# Altium schematic sheet Sheet_1.schdoc
size 292 x 205 mm; Device: A_A4; Symbol: A_A4; Name: A_A4; Designator: A; @Project Name: Orion S6; REV: 1.0; Date: 2026-10-26; Sheet: 1/1; Draw By: Mustafa Berisha; Company: Orion; Manufacturer Part: ?; Convert to PCB: yes; Add into BOM: yes; Origin Footprint: NONE; Unique ID: frame_lib_1
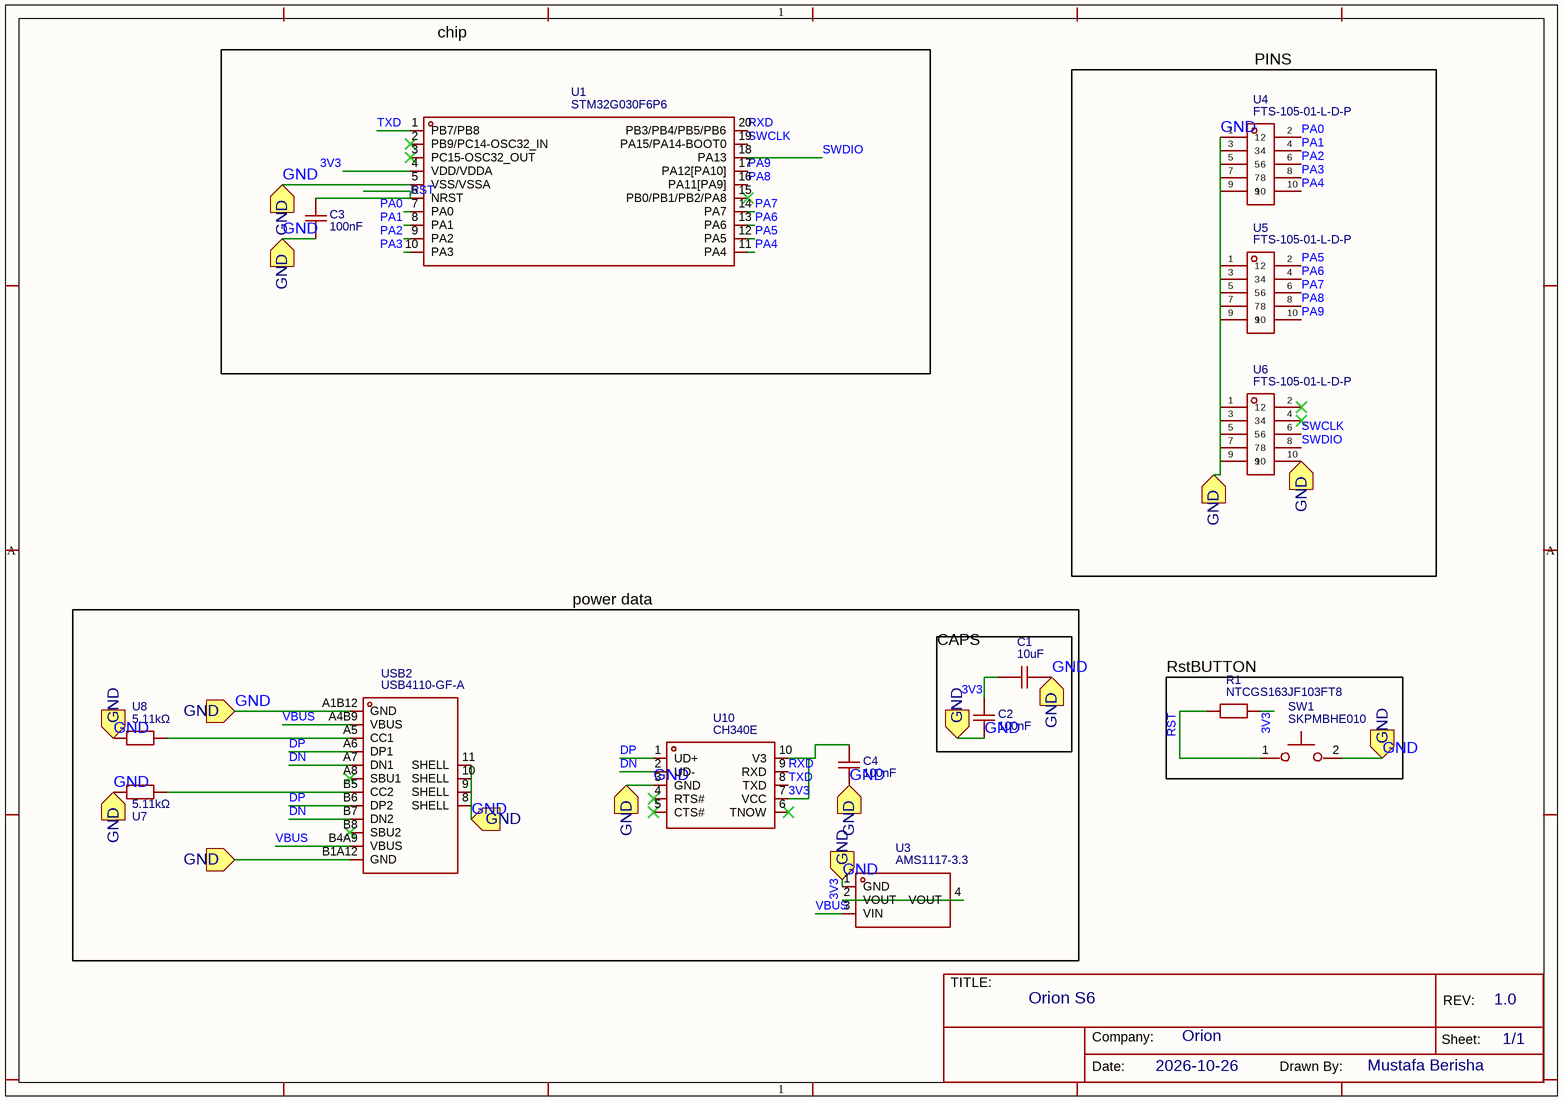
[diagram p0: Sheet_1.schdoc]

## Parts
C1  10uF  [C1206]
C2  100nF  [C0402]
C3  100nF  [C0402]
C4  100nF  [C0402]
R1  NTCGS163JF103FT8  [R0603]
SW1  SKPMBHE010  [KEY-SMD_2P-L6.0-W6.0-P6.00]
U1  STM32G030F6P6  [TSSOP-20_L6.5-W4.4-P0.65-LS6.4-BL]
U3  AMS1117-3.3  [SOT-223-3_L6.5-W3.4-P2.30-LS7.0-BR]
U4  FTS-105-01-L-D-P
U5  FTS-105-01-L-D-P
U6  FTS-105-01-L-D-P
U7  5.11kΩ  [RES-TH_BD2.4-L6.3-P10.30-D0.6]
U8  5.11kΩ  [RES-TH_BD2.4-L6.3-P10.30-D0.6]
U10  CH340E  [MSOP-10_L3.0-W3.0-P0.50-LS5.0-BL]
USB2  USB4110-GF-A  [USB-C-SMD_TYPE-C-16P-USB4110-GF-A]

## Blocks framed on the sheet
chip: C3 U1
PINS: U4-U6
power data: C4 U3 U7 U8 U10 USB2
CAPS: C1 C2
RstBUTTON: R1 SW1

## Ports
GND (in)

## Nets
3V3: C1.1 C2.1 C4.2 R1.2 U1.4(VDD/VDDA) U3.2(VOUT) U3.4(VOUT) U10.7(VCC) U10.10(V3)
DN: U10.2(UD-) USB2.A7(DN1) USB2.B7(DN2)
DP: U10.1(UD+) USB2.A6(DP1) USB2.B6(DP2)
GND: C1.2 C2.2 C3.1 C4.1 SW1.2 U1.5(VSS/VSSA) U3.1(GND) U4.1 U4.3 U4.5 U4.7 U4.9 U5.1 U5.3 U5.5 U5.7 U5.9 U6.1 U6.3 U6.5 U6.7 U6.9 U6.10 U7.2 U8.2 U10.3(GND) USB2.8(SHELL) USB2.9(SHELL) USB2.10(SHELL) USB2.11(SHELL) USB2.A1B12(GND) USB2.B1A12(GND) ; port GND
PA0: U1.7(PA0) U4.2
PA1: U1.8(PA1) U4.4
PA2: U1.9(PA2) U4.6
PA3: U1.10(PA3) U4.8
PA4: U1.11(PA4) U4.10
PA5: U1.12(PA5) U5.2
PA6: U1.13(PA6) U5.4
PA7: U1.14(PA7) U5.6
PA8: U1.16(PA11[PA9]) U5.8
PA9: U1.17(PA12[PA10]) U5.10
RST: C3.2 R1.1 SW1.1 U1.6(NRST)
RXD: U1.20(PB3/PB4/PB5/PB6) U10.9(RXD)
SWCLK: U1.19(PA15/PA14-BOOT0) U6.6
SWDIO: U1.18(PA13) U6.8
TXD: U1.1(PB7/PB8) U10.8(TXD)
VBUS: U3.3(VIN) USB2.A4B9(VBUS) USB2.B4A9(VBUS)
NetU7_1: U7.1 USB2.B5(CC2)
NetU8_1: U8.1 USB2.A5(CC1)

Not connected (* = marked no-connect by the designer): U1 2(PB9/PC14-OSC32_IN)* 3(PC15-OSC32_OUT)* 15(PB0/PB1/PB2/PA8)*; U6 2* 4*; U10 4(RTS#)* 5(CTS#)* 6(TNOW)*; USB2 A8(SBU1)* B8(SBU2)*

## Notes on the sheet
- TITLE:
- Orion S6
- Company:
- Orion
- Sheet:
- REV:
- 1.0
- 1/1
- Date:
- 2026-10-26
- Drawn By:
- Mustafa Berisha

## Library data of the parts
C1 = GRM31CR71E106MA12L: Manufacturer: muRata(村田); Convert to PCB: yes; UniqueId: ggec3e58f7991b46dfc; Device: GRM31CR71E106MA12L; Symbol: 10uF; Supplier: LCSC; Supplier Part: C440205; Manufacturer Part: GRM31CR71E106MA12L; JLCPCB Part Class: Extended Part; Add into BOM: yes; Origin Footprint: C1206; FootprintName: C1206
C2 = GCM155R71H104KE02D: Manufacturer: muRata(村田); Convert to PCB: yes; UniqueId: gge3603b7792e9a1127; ModelId: 89fda7647e4f421c9745a20fb37cf3430819f05c4eef4c71ace90d822a990e87; Device: GCM155R71H104KE02D; Symbol: 100nF; Supplier: LCSC; Manufacturer Part: GCM155R71H104KE02D; Supplier Part: C85858; JLCPCB Part Class: Extended Part; Add into BOM: yes; Origin Footprint: C0402; FootprintName: C0402; ModelName: C0402
C3 = GCM155R71H104KE02D: Manufacturer: muRata(村田); Convert to PCB: yes; UniqueId: gge7001e8d40063aff4; ModelId: 89fda7647e4f421c9745a20fb37cf3430819f05c4eef4c71ace90d822a990e87; Device: GCM155R71H104KE02D; Symbol: 100nF; Supplier: LCSC; Manufacturer Part: GCM155R71H104KE02D; Supplier Part: C85858; JLCPCB Part Class: Extended Part; Add into BOM: yes; Origin Footprint: C0402; FootprintName: C0402; ModelName: C0402
C4 = GCM155R71H104KE02D: Manufacturer: muRata(村田); Convert to PCB: yes; UniqueId: ggefa68e47fd06b38dc; ModelId: 89fda7647e4f421c9745a20fb37cf3430819f05c4eef4c71ace90d822a990e87; Device: GCM155R71H104KE02D; Symbol: 100nF; Supplier: LCSC; Manufacturer Part: GCM155R71H104KE02D; Supplier Part: C85858; JLCPCB Part Class: Extended Part; Add into BOM: yes; Origin Footprint: C0402; FootprintName: C0402; ModelName: C0402
R1 = NTCGS163JF103FT8: Manufacturer: TDK; Convert to PCB: yes; UniqueId: gge509d891d0711bf9c; ModelId: 112863783b5b41f1b5254f87eedc79320819f05c4eef4c71ace90d822a990e87; Device: NTCGS163JF103FT8; Symbol: NTCGS163JF103FT8; Supplier: LCSC; Supplier Part: C22432708; Manufacturer Part: NTCGS163JF103FT8; JLCPCB Part Class: Extended Part; Add into BOM: yes; Origin Footprint: R0603; FootprintName: R0603; ModelName: R0603
SW1 = SKPMBHE010: Manufacturer: ALPSALPINE(阿尔卑斯阿尔派); Convert to PCB: yes; UniqueId: gge61c93423a664275f; Device: SKPMBHE010; Symbol: SKPMBHE010; Supplier: LCSC; Manufacturer Part: SKPMBHE010; Supplier Part: C115350; JLCPCB Part Class: Extended Part; Add into BOM: yes; Origin Footprint: KEY-SMD_2P-L6.0-W6.0-P6.00; FootprintName: KEY-SMD_2P-L6.0-W6.0-P6.00
U1 = STM32G030F6P6: Manufacturer: ST(意法半导体); Convert to PCB: yes; UniqueId: gge453bc29e258892ef; Device: STM32G030F6P6; Symbol: STM32G030F6P6; Supplier: LCSC; Supplier Part: C724040; Manufacturer Part: STM32G030F6P6; JLCPCB Part Class: Extended Part; Add into BOM: yes; Origin Footprint: TSSOP-20_L6.5-W4.4-P0.65-LS6.4-BL; FootprintName: TSSOP-20_L6.5-W4.4-P0.65-LS6.4-BL
U3 = AMS1117-3.3: Manufacturer: Advanced Monolithic Systems; Convert to PCB: yes; UniqueId: ggec4d5dda7eaf5b224; Device: AMS1117-3.3; Symbol: AMS1117-3.3; Supplier: LCSC; Manufacturer Part: AMS1117-3.3; Supplier Part: C6186; JLCPCB Part Class: Basic Part; Add into BOM: yes; Origin Footprint: SOT-223-3_L6.5-W3.4-P2.30-LS7.0-BR; FootprintName: SOT-223-3_L6.5-W3.4-P2.30-LS7.0-BR
U4 = FTS-105-01-L-D-P: Convert to PCB: yes; Origin Footprint: FTS-105-01-F-D; UniqueId: gge535a07606f2fda83; Device: FTS-105-01-L-D-P; Symbol: FTS-105-01-L-D-P; Manufacturer: FTS-105-01-L-D-P; Supplier: Mouser; Supplier Part: 200-FTS10501LDP; link: https://www.mouser.fr/ProductDetail/Samtec/FTS-105-01-L-D-P?qs=Cqqh%252BS766wmXh%2FxfxY38TA%3D%3D; Add into BOM: yes
U5 = FTS-105-01-L-D-P: Convert to PCB: yes; Origin Footprint: FTS-105-01-F-D; UniqueId: gge50ce325288323539; Device: FTS-105-01-L-D-P; Symbol: FTS-105-01-L-D-P; Manufacturer: FTS-105-01-L-D-P; Supplier: Mouser; Supplier Part: 200-FTS10501LDP; link: https://www.mouser.fr/ProductDetail/Samtec/FTS-105-01-L-D-P?qs=Cqqh%252BS766wmXh%2FxfxY38TA%3D%3D; Add into BOM: yes
U6 = FTS-105-01-L-D-P: Convert to PCB: yes; Origin Footprint: FTS-105-01-F-D; UniqueId: ggef7dac69be00742ba; Device: FTS-105-01-L-D-P; Symbol: FTS-105-01-L-D-P; Manufacturer: FTS-105-01-L-D-P; Supplier: Mouser; Supplier Part: 200-FTS10501LDP; link: https://www.mouser.fr/ProductDetail/Samtec/FTS-105-01-L-D-P?qs=Cqqh%252BS766wmXh%2FxfxY38TA%3D%3D; Add into BOM: yes
U7 = MF0207FTE52-5K11: Manufacturer: YAGEO(国巨); Convert to PCB: yes; UniqueId: ggec685899ae778320e; ModelId: 1723974b41284f5c8da509f1f508e9550819f05c4eef4c71ace90d822a990e87; Device: MF0207FTE52-5K11; Symbol: 5.11kΩ; Supplier: LCSC; Supplier Part: C1374866; Manufacturer Part: MF0207FTE52-5K11; JLCPCB Part Class: Extended Part; Add into BOM: yes; Origin Footprint: RES-TH_BD2.4-L6.3-P10.30-D0.6; FootprintName: RES-TH_BD2.4-L6.3-P10.30-D0.6; ModelName: RES-TH_BD2.4-L6.3-P10.30-D0.6
U8 = MF0207FTE52-5K11: Manufacturer: YAGEO(国巨); Convert to PCB: yes; UniqueId: gge81b50a1914431335; ModelId: 1723974b41284f5c8da509f1f508e9550819f05c4eef4c71ace90d822a990e87; Device: MF0207FTE52-5K11; Symbol: 5.11kΩ; Supplier: LCSC; Supplier Part: C1374866; Manufacturer Part: MF0207FTE52-5K11; JLCPCB Part Class: Extended Part; Add into BOM: yes; Origin Footprint: RES-TH_BD2.4-L6.3-P10.30-D0.6; FootprintName: RES-TH_BD2.4-L6.3-P10.30-D0.6; ModelName: RES-TH_BD2.4-L6.3-P10.30-D0.6
U10 = CH340E: Manufacturer: WCH(南京沁恒); Convert to PCB: yes; UniqueId: gge83d6ddbc7f9ec333; Device: CH340E; Symbol: CH340E; Supplier: LCSC; Manufacturer Part: CH340E; Supplier Part: C99652; JLCPCB Part Class: Extended Part; Add into BOM: yes; Origin Footprint: MSOP-10_L3.0-W3.0-P0.50-LS5.0-BL; FootprintName: MSOP-10_L3.0-W3.0-P0.50-LS5.0-BL
USB2 = USB4110-GF-A: Manufacturer: GCT; Convert to PCB: yes; UniqueId: gge5c2b11402056eb1e; Device: USB4110-GF-A; Symbol: USB4110-GF-A; Supplier: LCSC; Supplier Part: C5143397; Manufacturer Part: USB4110-GF-A; JLCPCB Part Class: Extended Part; Add into BOM: yes; Origin Footprint: USB-C-SMD_TYPE-C-16P-USB4110-GF-A; FootprintName: USB-C-SMD_TYPE-C-16P-USB4110-GF-A